# Altium schematic sheet port.SchDoc
size A4; SheetNumber: 4; SheetTotal: 6
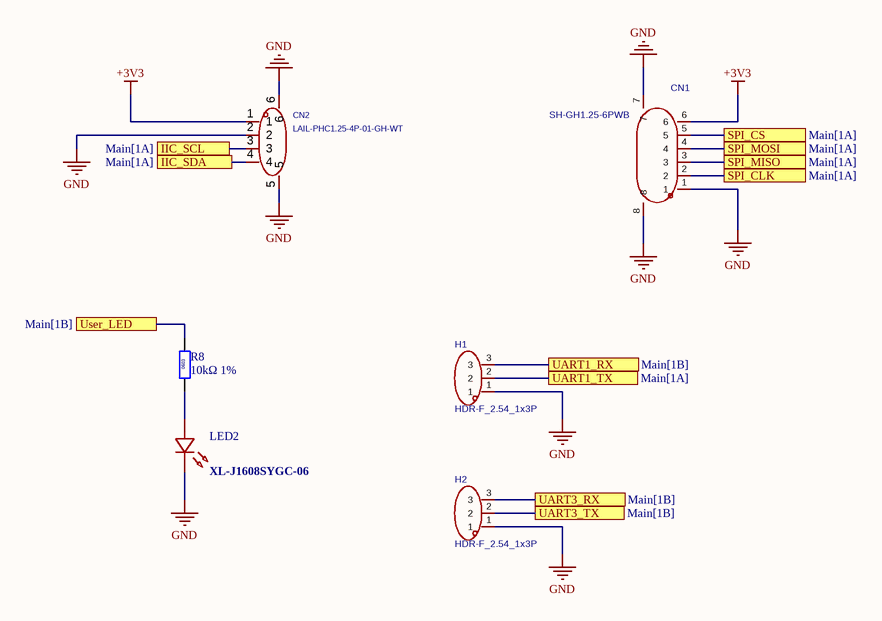
[diagram p0: port.SchDoc]

## Parts
CN1  SH-GH1.25-6PWB  [SW-SMD_SH-GH1.25-6PWB]
CN2  LAIL-PHC1.25-4P-01-GH-WT  [CONN-SMD_4P-P1.25_HCTL_HC-GH-4PWTKK]
H1  HDR-F_2.54_1x3P  [HDR-TH_3P-P2.54-V-F]
H2  HDR-F_2.54_1x3P  [HDR-TH_3P-P2.54-V-F]
LED2  XL-J1608SYGC-06  [LED0603-FD_GREEN]
R8  10kΩ 1%  [R0603]

## Ports
IIC_SCL (see Main[1A]), IIC_SDA (see Main[1A]), SPI_CLK (see Main[1A]), SPI_CS (see Main[1A]), SPI_MISO (see Main[1A]), SPI_MOSI (see Main[1A]), UART1_RX (see Main[1B]), UART1_TX (see Main[1A]), UART3_RX (see Main[1B]), UART3_TX (see Main[1B]), User_LED (see Main[1B])

## Nets
+3V3: CN1.6 CN2.1
GND: CN1.1 CN1.7 CN1.8 CN2.2 CN2.5 CN2.6 H1.1 H2.1 LED2.2(C)
IIC_SCL: CN2.3 ; port IIC_SCL
IIC_SDA: CN2.4 ; port IIC_SDA
SPI_CLK: CN1.2 ; port SPI_CLK
SPI_CS: CN1.5 ; port SPI_CS
SPI_MISO: CN1.3 ; port SPI_MISO
SPI_MOSI: CN1.4 ; port SPI_MOSI
UART1_RX: H1.3 ; port UART1_RX
UART1_TX: H1.2 ; port UART1_TX
UART3_RX: H2.3 ; port UART3_RX
UART3_TX: H2.2 ; port UART3_TX
User_LED: R8.2 ; port User_LED
NetLED2_1: LED2.1(A) R8.1

## Notes on the sheet
- (in symbol R0603) 0603

## Library data of the parts
CN1 = SH-GH1.25-6PWB: 插针结构:1x6P;间距:1.25mm;安装方式:卧贴;参考系列:GH;总PIN数:6P;排数:1;每排PIN数:6;行距:-;额定电流:1A;触头材质:磷青铜;触头镀层:锡;工作温度:-25℃~+85℃;; Manufacturer: SHOU HAN(首韩); AddInBom: yes; ModelId: e09572dfa6674d54b7c86450513a2389聨0819f05c4eef4c71ace90d822a990e87; ModelTransform: 423.6212,188.976,0,0,0,0,0.001,-12.675,0; Pins Structure: 1x6P; Pitch: 1.25mm; Reference Series: GH; Number of PINs Per Row: 6; Current Rating: 1A; Voltage Rating: 125V; Plastic Material: LCP; Flame Retardant Rating: UL94V-0; Symbol: SH-GH1.25-6PWB; Device: SH-GH1.25-6PWB; LCSC Part Name: 米色 1x6P 间距:1.25mm 卧贴 系列:GH; SupplierPart: C42372473; ManufacturerPart: SH-GH1.25-6PWB; Supplier Footprint: SMD,P=1.25mm,卧贴; JLCPCB Part Class: Extended Part; Datasheet: https://item.szlcsc.com/datasheet/SH-GH1.25-6PWB/44255911.html; Supplier: LCSC; ConvertToPcb: yes; FootprintName: SW-SMD_SH-GH1.25-6PWB; ModelName: SW-SMD_SH-GH1.25-6PWB; Mounting Type: 卧贴; Number of Pins: 6P; Number of Rows: 1; Row Spacing: -; Contact Material: 磷青铜; Contact Plating: 锡; Operating Temperature: -25℃~+85℃; Supplementary Features: -; Color: 米色
CN2 = LAIL-PHC1.25-4P-01-GH-WT: 插针结构:1x4P;间距:1.25mm;安装方式:卧贴;参考系列:GH;总PIN数:4P;排数:1;每排PIN数:4;额定电流:1A;触头材质:磷青铜;触头镀层:锡;工作温度:-25℃~+85℃;; Manufacturer: LAILAN(莱联); AddInBom: yes; ModelId: be1f9715b107443eaa221cf46be59155聨0819f05c4eef4c71ace90d822a990e87; ModelTransform: 326.771,190.9445,0,0,0,0,0,-8.858,0; Pins Structure: 1x4P; Pitch: 1.25mm; Reference Series: GH; Number of PINs Per Row: 4; Current Rating: 1A; Voltage Rating: 50V; Plastic Material: LCP; Flame Retardant Rating: UL94V-0; Supplementary Features: 辅助焊脚; Z-Height of the Board: 4.4mm; X-Length of Bottom Edge on Board (Spacing Line): 8.25mm; Y-Width of Bottom Edge on Board: 4.9mm; Symbol: LAIL-PHC1.25-4P-01-GH-WT; Device: LAIL-PHC1.25-4P-01-GH-WT; LCSC Part Name: 1x4P 间距:1.25mm 卧贴 系列:GH; SupplierPart: C54905900; ManufacturerPart: LAIL-PHC1.25-4P-01-GH-WT; Supplier Footprint: SMD,P=1.25mm,卧贴; JLCPCB Part Class: Extended Part; Datasheet: https://item.szlcsc.com/datasheet/LAIL-PHC1.25-4P-01-GH-WT/58431077.html; Supplier: LCSC; ConvertToPcb: yes; FootprintName: CONN-SMD_4P-P1.25_HCTL_HC-GH-4PWTKK; ModelName: CONN-SMD_4P-P1.25_HCTL_HC-GH-4PWTKK; Mounting Type: 卧贴; Number of Pins: 4P; Number of Rows: 1; Contact Material: 磷青铜; Contact Plating: 锡; Operating Temperature: -25℃~+85℃; Color: 米黄色
H1 H2 = HDR-F_2.54_1x3P: Symbol: PM254V-11-03-H85; ConvertToPcb: yes; ModelId: f3b3cc5aae9641bf9e56fc160cef875b聨0819f05c4eef4c71ace90d822a990e87; ModelName: HDR2.54-F-LI-1X3P; ModelTransform: 299.9994,100,0,0,0,0,0,0,-118.11; Device: HDR-F_2.54_1x3P; AddInBom: yes; SupplierPart: C541850; Supplier Footprint: 插件; FootprintName: HDR-TH_3P-P2.54-V-F
LED2 = LED_0603_G: 灯头类型:1.6mmx0.8mm方形灯头;发光颜色:黄绿色;正向压降(Vf):1.9V~2.1V;功率:60mW;正向电流:20mA;波长:565nm~575nm;二极管配置:独立二极管;透镜颜色:无色透明透镜;色温:-;发光强度:80mcd;发光角度:120°;载带方式:-;工作温度:-40℃~+85℃;; Manufacturer: XINGLIGHT(成兴光); AddInBom: yes; ModelId: 1ce04384e8434edd9926301526d5d892聨0819f05c4eef4c71ace90d822a990e87; ModelTransform: 62.992,31.8897,0,0,0,0,0,0,0; Illumination Color: 黄绿色; Power(Watts): 60mW; Forward Current: 20mA; Peak Wavelength: 570nm; Diode Configuration: 独立二极管; Lens Color: 无色透明透镜; Luminous Intensity: 80mcd; Viewing Angle: 120°; Symbol: XL-J1608SYGC-06; Device: XL-J1608SYGC-06; LCSC Part Name: 0603普绿0.6T（金版）; SupplierPart: C48586672; ManufacturerPart: XL-J1608SYGC-06; Supplier Footprint: SMD; JLCPCB Part Class: Extended Part; Datasheet: https://item.szlcsc.com/datasheet/XL-J1608SYGC-06/50855282.html; Supplier: LCSC; ConvertToPcb: yes; FootprintName: LED0603-FD_GREEN; ModelName: LED0603-FD_GREEN; Lamp Holder Type: 1.6mmx0.8mm方形灯头; Voltage - Forward(Vf): 1.9V~2.1V; Wavelength - Dominant: 565nm~575nm; Color Temperature: -; Mounting Style: -; Operating Temperature: -40℃~+85℃
R8 = R0603: 贴片电阻; Package: R0603